# Altium schematic sheet Chassis_Bridge_verL.SchDoc
size A4
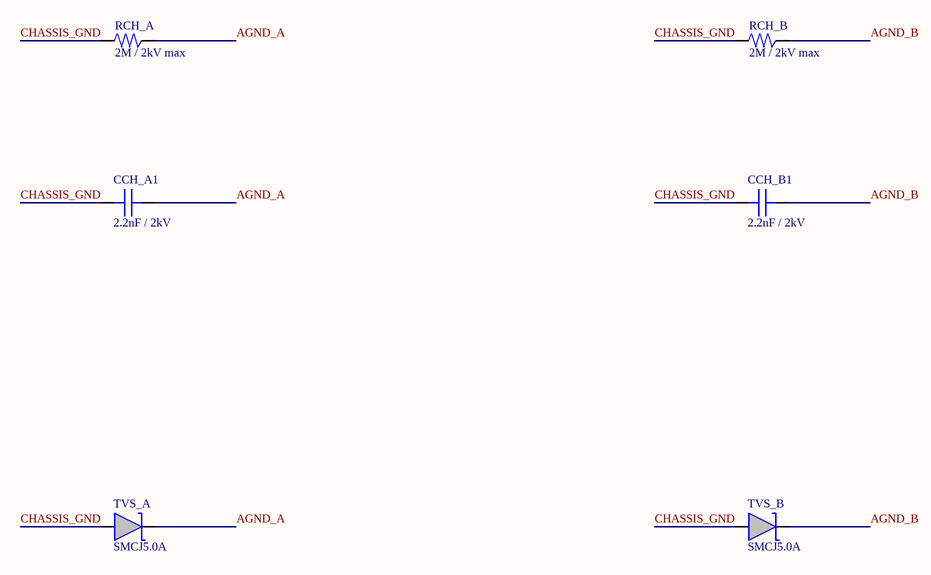
[diagram p0: Chassis_Bridge_verL.SchDoc]

## Parts
CCH_A1  2.2nF / 2kV  [QB_CHASSIS_C1206_X7R_2KV]
CCH_B1  2.2nF / 2kV  [QB_CHASSIS_C1206_X7R_2KV]
RCH_A  2M / 2kV max  [QB_CHASSIS_R2010_HV]
RCH_B  2M / 2kV max  [QB_CHASSIS_R2010_HV]
TVS_A  SMCJ5.0A  [QB_CHASSIS_SMC_AK]
TVS_B  SMCJ5.0A  [QB_CHASSIS_SMC_AK]

## Nets
AGND_A: CCH_A1.2 RCH_A.2 TVS_A.2(K)
AGND_B: CCH_B1.2 RCH_B.2 TVS_B.2(K)
CHASSIS_GND: CCH_A1.1 CCH_B1.1 RCH_A.1 RCH_B.1 TVS_A.1(A) TVS_B.1(A)

## Library data of the parts
CCH_A1 CCH_B1 = CHASSIS_CAP_HV: MPN: C1206C222KGRACTU; Manufacturer: KEMET; PCB_Status: CORNER_BRIDGE_DRAFT_PULSE_QUALIFICATION_PENDING; Voltage_Rating: 2000V; Qualification: Lightning waveform qualification pending
RCH_A RCH_B = CHASSIS_HV_R_2M: 2Mohm >=2kV bridge resistor; part, power/pulse rating and footprint pending; MPN: CHV2010-FX-2004ELF; Manufacturer: Bourns; PCB_Status: CORNER_BRIDGE_DRAFT_PULSE_QUALIFICATION_PENDING; Voltage_Rating: 2000V; Qualification: R 2kV voltage ceiling is not a continuous 2kV/2M load qualification
TVS_A TVS_B = CHASSIS_TVS_SMCJ: MPN: SMCJ5.0A-E3/57T; Manufacturer: Vishay; PCB_Status: CORNER_BRIDGE_DRAFT_PULSE_QUALIFICATION_PENDING; Voltage_Rating: 5V standoff; Qualification: Lightning waveform qualification pending